# Altium schematic sheet ECUConnectors.SchDoc: Conectores da ECU
size 420 x 297 mm; Author: Matheus Markies; DrawnBy: Matheus Markies; Engineer: Matheus Markies; DocumentNumber: ECTU-SCH-11; Revision: A definir; SheetNumber: 11; SheetTotal: 12; ProjectTitle: ROUTE ECU / ECTU; DocumentStatus: Em desenvolvimento; DocumentDate: 14/10/2026
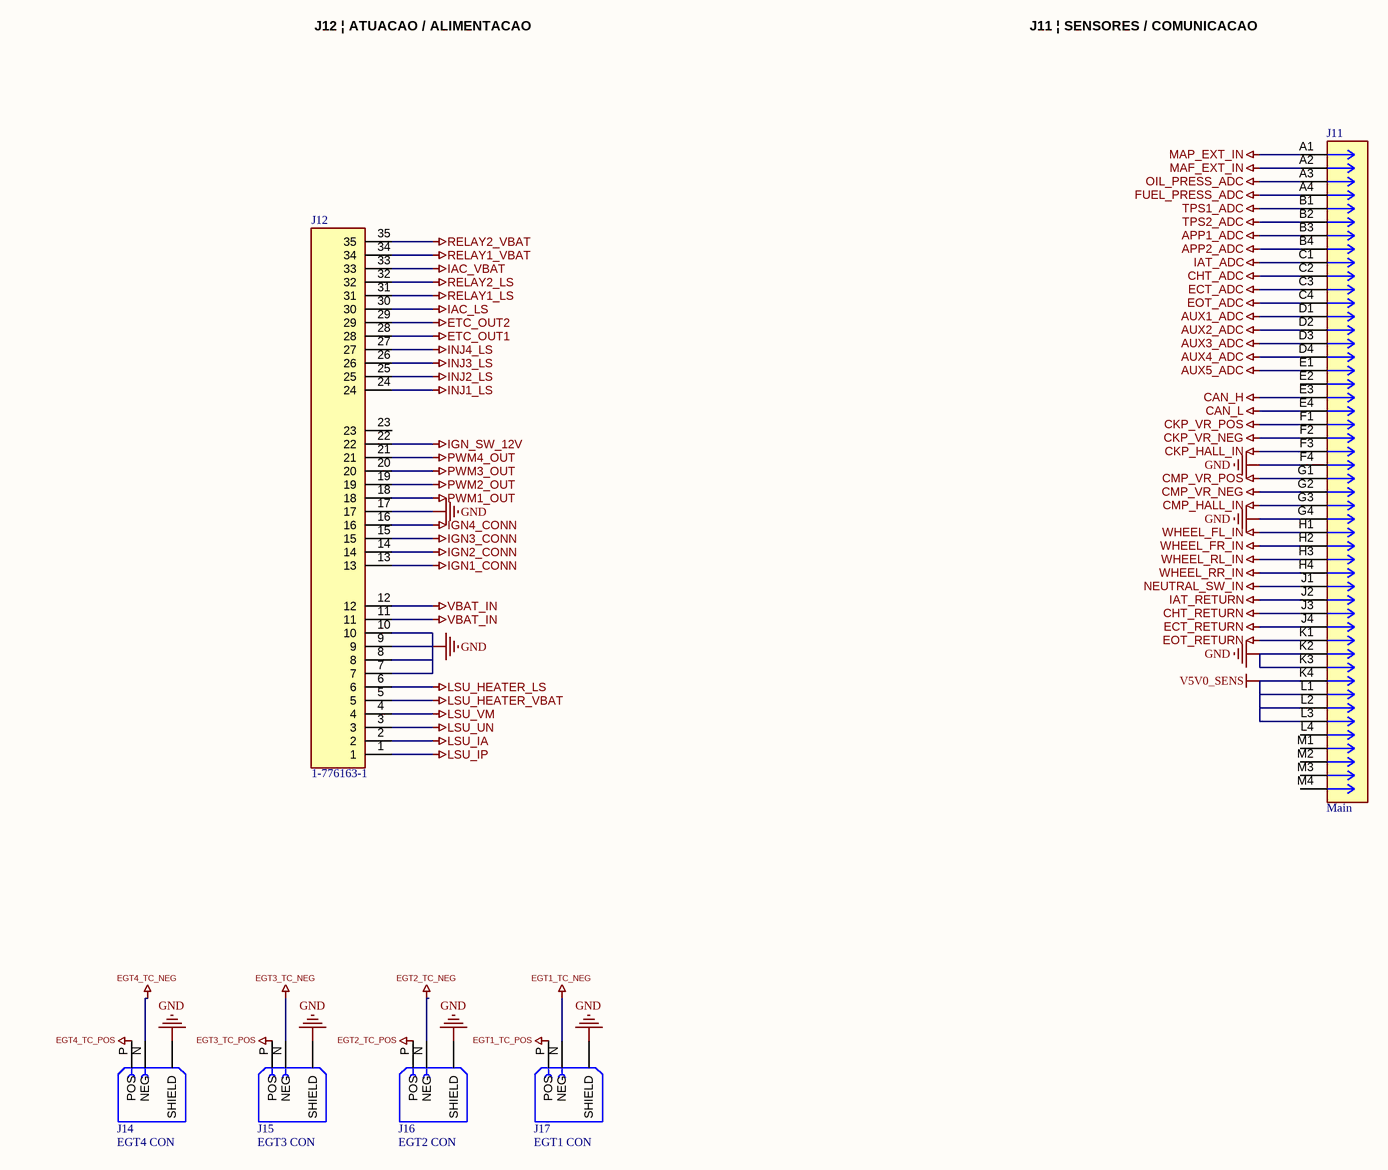
[diagram p0: ECUConnectors.SchDoc]

## Parts
J11  Main  [CONN_SD-500762-001_MOL]
J12  1-776163-1  [TE_1-776163-1]
J14  EGT4 CON  [OMEGA_PCC-SMP-K-5]
J15  EGT3 CON  [OMEGA_PCC-SMP-K-5]
J16  EGT2 CON  [OMEGA_PCC-SMP-K-5]
J17  EGT1 CON  [OMEGA_PCC-SMP-K-5]

## Nets
APP1_ADC: J11.B3
APP2_ADC: J11.B4
AUX1_ADC: J11.D1
AUX2_ADC: J11.D2
AUX3_ADC: J11.D3
AUX4_ADC: J11.D4
AUX5_ADC: J11.E1
CAN_H: J11.E3
CAN_L: J11.E4
CHT_ADC: J11.C2
CHT_RETURN: J11.J3
CKP_HALL_IN: J11.F3
CKP_VR_NEG: J11.F2
CKP_VR_POS: J11.F1
CMP_HALL_IN: J11.G3
CMP_VR_NEG: J11.G2
CMP_VR_POS: J11.G1
ECT_ADC: J11.C3
ECT_RETURN: J11.J4
EGT1_TC_NEG: J17.N(NEG)
EGT1_TC_POS: J17.P(POS)
EGT2_TC_NEG: J16.N(NEG)
EGT2_TC_POS: J16.P(POS)
EGT3_TC_NEG: J15.N(NEG)
EGT3_TC_POS: J15.P(POS)
EGT4_TC_NEG: J14.N(NEG)
EGT4_TC_POS: J14.P(POS)
EOT_ADC: J11.C4
EOT_RETURN: J11.K1
ETC_OUT1: J12.28
ETC_OUT2: J12.29
FUEL_PRESS_ADC: J11.A4
GND: J11.F4 J11.G4 J11.K2 J11.K3 J12.7 J12.8 J12.9 J12.10 J12.17 J14.S1(SHIELD) J14.S2(SHIELD) J15.S1(SHIELD) J15.S2(SHIELD) J16.S1(SHIELD) J16.S2(SHIELD) J17.S1(SHIELD) J17.S2(SHIELD)
IAC_LS: J12.30
IAC_VBAT: J12.33
IAT_ADC: J11.C1
IAT_RETURN: J11.J2
IGN1_CONN: J12.13
IGN2_CONN: J12.14
IGN3_CONN: J12.15
IGN4_CONN: J12.16
IGN_SW_12V: J12.22
INJ1_LS: J12.24
INJ2_LS: J12.25
INJ3_LS: J12.26
INJ4_LS: J12.27
LSU_HEATER_LS: J12.6
LSU_HEATER_VBAT: J12.5
LSU_IA: J12.2
LSU_IP: J12.1
LSU_UN: J12.3
LSU_VM: J12.4
MAF_EXT_IN: J11.A2
MAP_EXT_IN: J11.A1
NEUTRAL_SW_IN: J11.J1
OIL_PRESS_ADC: J11.A3
PWM1_OUT: J12.18
PWM2_OUT: J12.19
PWM3_OUT: J12.20
PWM4_OUT: J12.21
RELAY1_LS: J12.31
RELAY1_VBAT: J12.34
RELAY2_LS: J12.32
RELAY2_VBAT: J12.35
TPS1_ADC: J11.B1
TPS2_ADC: J11.B2
V5V0_SENS: J11.K4 J11.L1 J11.L2 J11.L3
VBAT_IN: J12.11 J12.12
WHEEL_FL_IN: J11.H1
WHEEL_FR_IN: J11.H2
WHEEL_RL_IN: J11.H3
WHEEL_RR_IN: J11.H4

Not connected (* = marked no-connect by the designer): J11 E2 L4 M1 M2 M3 M4; J12 23

## Notes on the sheet
- J12 | ATUACAO / ALIMENTACAO
- J11 | SENSORES / COMUNICACAO
- PROJETO
- STATUS
- FOLHA / SUBSISTEMA
- AUTOR
- CÓDIGO DO DESENHO
- ARQUIVO
- ATUALIZAÇÃO
- REVISÃO
- FOLHA
- FORMATO
- A3
- /

## Library data of the parts
J11 = 5007620483: Package: None; Price: None; Value: *; MP: 5007620483; Availability: Unavailable
J12 = 1-776163-1: AMPSEAL Series, 35 Way Through Hole Plug Power Conn, with Solder Termination | TE Connectivity 1-776163-1; SnapEDA_Link: https://www.snapeda.com/parts/1-776163-1/TE+Connectivity+AMP+Connectors/view-part/?ref=snap; Package: None; Value: *; MF: TE Connectivity; MP: 1-776163-1; EU_RoHS_Compliance: Compliant; Check_prices: https://www.snapeda.com/parts/1-776163-1/TE+Connectivity+AMP+Connectors/view-part/?ref=eda
J14-J17 = PCC-SMP-K-5: Thermocouple Conn, K Type, Rcpt, Pk 5; MF: Omega Engineering; SnapEDA_Link: https://www.snapeda.com/parts/PCC-SMP-K-5/Omega+Engineering/view-part/?ref=snap; Package: None; Value: *; MP: PCC-SMP-K-5; Check_prices: https://www.snapeda.com/parts/PCC-SMP-K-5/Omega+Engineering/view-part/?ref=eda